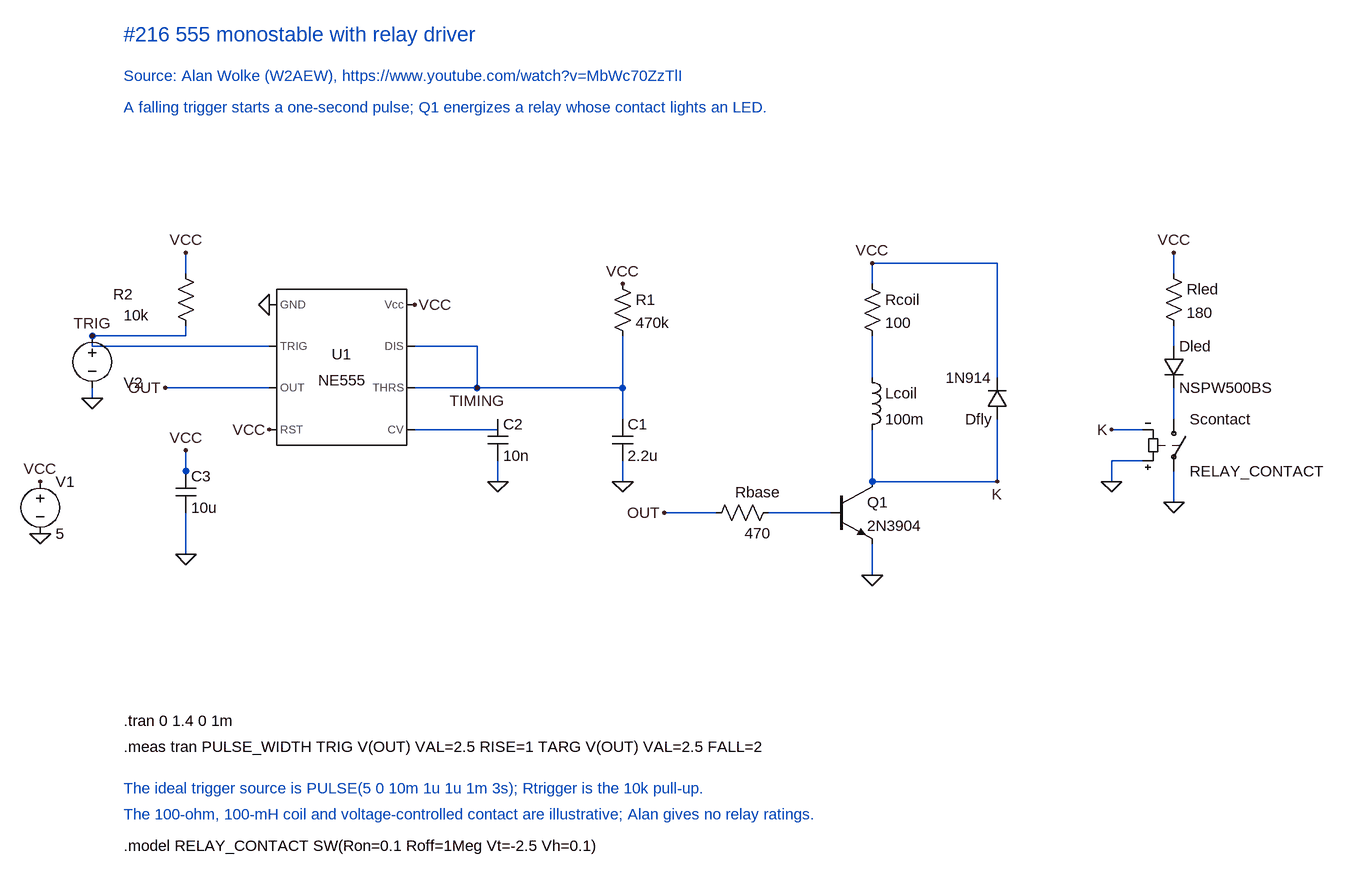
[diagram p0: schematic 555 relay one-shot.asc]
555 relay one-shot.asc, the LTspice schematic file:
Version 4.1
SHEET 1 1904 1220
WIRE 160 176 160 144
WIRE 160 272 160 256
WIRE 160 272 16 272
WIRE 160 496 160 448
WIRE 160 608 160 544
WIRE 16 288 16 272
WIRE 288 288 16 288
WIRE 16 368 16 352
WIRE 608 288 512 288
WIRE 608 352 608 288
WIRE 608 352 512 352
WIRE 832 352 608 352
WIRE 832 272 832 352
WIRE 832 400 832 352
WIRE 640 400 640 416
WIRE 640 416 512 416
WIRE 640 496 640 464
WIRE 832 496 832 464
WIRE 1216 192 1216 160
WIRE 1216 336 1216 272
WIRE 1216 496 1216 416
WIRE 1216 640 1216 592
WIRE 1408 160 1216 160
WIRE 1408 336 1408 160
WIRE 1408 496 1408 400
WIRE 1408 496 1216 496
WIRE 976 544 896 544
WIRE 1152 544 1056 544
WIRE 1680 176 1680 144
WIRE 1680 288 1680 256
WIRE 1680 400 1680 352
WIRE 1680 528 1680 480
WIRE 1632 416 1584 416
WIRE 1632 464 1584 464
WIRE 1584 496 1584 464
FLAG 16 272 TRIG
FLAG 16 368 0
FLAG 288 224 0
FLAG 288 416 VCC
WIRE 288 352 128 352
FLAG 128 352 OUT
FLAG 512 224 VCC
FLAG 640 496 0
FLAG 832 192 VCC
FLAG 832 496 0
FLAG 608 352 TIMING
FLAG -64 496 VCC
FLAG -64 576 0
FLAG 160 144 VCC
FLAG 160 448 VCC
FLAG 160 608 0
FLAG 1216 160 VCC
FLAG 1408 496 K
FLAG 1216 640 0
FLAG 896 544 OUT
FLAG 1680 144 VCC
FLAG 1680 528 0
FLAG 1584 416 K
FLAG 1584 496 0
SYMBOL voltage 16 256 R0
WINDOW 0 48 88 Left 2
WINDOW 3 0 0 Invisible 2
SYMATTR InstName V2
SYMATTR Value PULSE(5 0 10m 1u 1u 1m 3s)
SYMBOL voltage -64 480 R0
SYMATTR InstName V1
SYMATTR Value 5
SYMBOL res 144 160 R0
WINDOW 0 -96 48 Left 2
WINDOW 3 -80 80 Left 2
SYMATTR InstName R2
SYMATTR Value 10k
SYMBOL cap 144 480 R0
SYMATTR InstName C3
SYMATTR Value 10u
SYMBOL Misc\NE555 400 320 R0
SYMATTR InstName U1
SYMATTR Value NE555
SYMBOL cap 624 400 R0
SYMATTR InstName C2
SYMATTR Value 10n
SYMBOL res 816 176 R0
SYMATTR InstName R1
SYMATTR Value 470k
SYMBOL cap 816 400 R0
SYMATTR InstName C1
SYMATTR Value 2.2u
SYMBOL res 1072 528 R90
WINDOW 0 0 32 VBottom 2
WINDOW 3 32 32 VTop 2
SYMATTR InstName Rbase
SYMATTR Value 470
SYMBOL npn 1152 496 R0
SYMATTR InstName Q1
SYMATTR Value 2N3904
SYMBOL res 1200 176 R0
SYMATTR InstName Rcoil
SYMATTR Value 100
SYMBOL ind 1200 320 R0
SYMATTR InstName Lcoil
SYMATTR Value 100m
SYMBOL diode 1424 400 R180
SYMATTR InstName Dfly
SYMATTR Value 1N914
SYMBOL res 1664 160 R0
SYMATTR InstName Rled
SYMATTR Value 180
SYMBOL diode 1664 288 R0
SYMATTR InstName Dled
SYMATTR Value NSPW500BS
SYMBOL sw 1680 384 R0
SYMATTR InstName Scontact
SYMATTR Value RELAY_CONTACT
TEXT 64 864 Left 2 !.tran 0 1.4 0 1m
TEXT 64 904 Left 2 !.meas tran PULSE_WIDTH TRIG V(OUT) VAL=2.5 RISE=1 TARG V(OUT) VAL=2.5 FALL=2
TEXT 64 968 Left 2 ;The ideal trigger source is PULSE(5 0 10m 1u 1u 1m 3s); Rtrigger is the 10k pull-up.
TEXT 64 1008 Left 2 ;The 100-ohm, 100-mH coil and voltage-controlled contact are illustrative; Alan gives no relay ratings.
TEXT 64 1056 Left 2 !.model RELAY_CONTACT SW(Ron=0.1 Roff=1Meg Vt=-2.5 Vh=0.1)
TEXT 64 -192 Left 3 ;#216 555 monostable with relay driver
TEXT 64 -128 Left 2 ;Source: Alan Wolke (W2AEW), https://www.youtube.com/watch?v=MbWc70ZzTlI
TEXT 64 -80 Left 2 ;A falling trigger starts a one-second pulse; Q1 energizes a relay whose contact lights an LED.

The netlist it stands for:
* 555 relay one-shot.asc
V2 TRIG 0 PULSE(5 0 10m 1u 1u 1m 3s)
V1 VCC 0 5
R2 VCC TRIG 10k
C3 VCC 0 10u
X§U1 0 TRIG OUT VCC N001 TIMING TIMING VCC NE555  ; pins GND TRIG OUT RST CV THRS DIS Vcc
C2 N001 0 10n
R1 VCC TIMING 470k
C1 TIMING 0 2.2u
Rbase N003 OUT 470
Q1 K N003 0 0 2N3904
Rcoil VCC N002 100
Lcoil N002 K 100m
Dfly K VCC 1N914
Rled VCC N004 180
Dled N004 N005 NSPW500BS
Scontact N005 0 0 K RELAY_CONTACT
.model D D
.lib standard.dio
.model NPN NPN
.model PNP PNP
.lib standard.bjt
.tran 0 1.4 0 1m
.meas tran PULSE_WIDTH TRIG V(OUT) VAL=2.5 RISE=1 TARG V(OUT) VAL=2.5 FALL=2
* The ideal trigger source is PULSE(5 0 10m 1u 1u 1m 3s); Rtrigger is the 10k pull-up.
* The 100-ohm, 100-mH coil and voltage-controlled contact are illustrative; Alan gives no relay ratings.
.model RELAY_CONTACT SW(Ron=0.1 Roff=1Meg Vt=-2.5 Vh=0.1)
* #216 555 monostable with relay driver
* Source: Alan Wolke (W2AEW), https://www.youtube.com/watch?v=MbWc70ZzTlI
* A falling trigger starts a one-second pulse; Q1 energizes a relay whose contact lights an LED.
.lib NE555.sub
.backanno
.end